# Altium schematic sheet STPMotorControl2_1.SchDoc
size A4; SheetNumber: 3; SheetTotal: 6
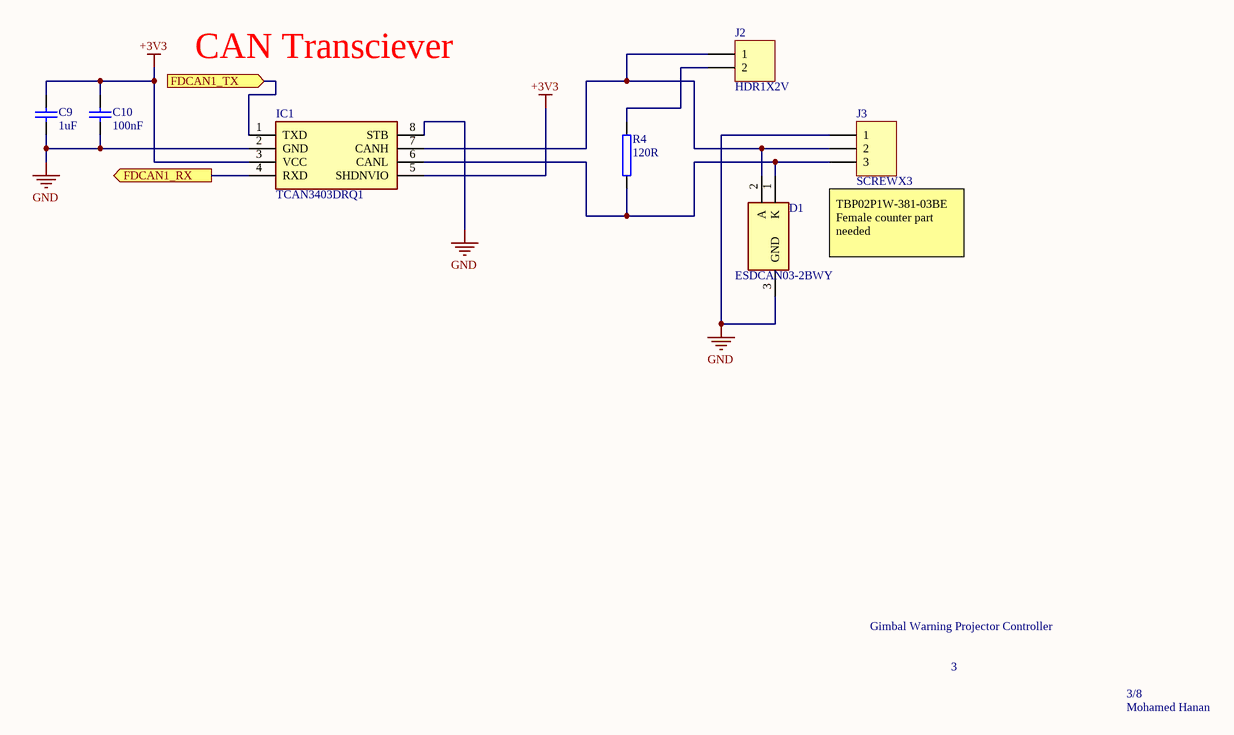
[diagram p0: STPMotorControl2_1.SchDoc]

## Parts
C9  1uF  [CAP_0805]
C10  100nF  [CAP_0805]
D1  ESDCAN03-2BWY  [SOT65P210X110-3N]
IC1  TCAN3403DRQ1  [SOIC127P600X175-8N]
J2  HDR1X2V  [HDR1X2_AUT]
J3  SCREWX3  [SCREW3_AUT]
R4  120R  [RES_1206]

## Ports
FDCAN1_RX (out, see STPMotorConnections[3A], STPMotorControl_1[3C]), FDCAN1_TX (in, see STPMotorConnections[3A], STPMotorControl_1[3C])

## Nets
+3V3: C9.2 C10.2 IC1.3(VCC) IC1.5(SHDNVIO)
GND: C9.1 C10.1 D1.3(GND) IC1.2(GND) IC1.8(STB) J3.1
FDCAN1_RX: IC1.4(RXD) ; port FDCAN1_RX
FDCAN1_TX: IC1.1(TXD) ; port FDCAN1_TX
NetD1_1: D1.1(K) IC1.6(CANL) J3.3 R4.1
NetD1_2: D1.2(A) IC1.7(CANH) J2.1 J3.2
NetJ2_2: J2.2 R4.2

## Notes on the sheet
- CAN Transciever
- (near J3) TBP02P1W-381-03BE
  Female counter part needed
- Gimbal Warning Projector Controller
- 3
- 3/8
- Mohamed Hanan

## Library data of the parts
C9 C10 = CAPN 0805: Non Polarized Capacitor, SMD, 0805
D1 = ESDCAN03-2BWY: TVS Diode (Uni-directional); Manufacturer_Name: STMicroelectronics; Datasheet Link: https://www.st.com/resource/en/datasheet/esdcan03-2bwy.pdf; Height: 1.1mm; Manufacturer_Part_Number: ESDCAN03-2BWY; Mouser Part Number: 511-ESDCAN03-2BWY; Mouser Price/Stock: https://www.mouser.co.uk/ProductDetail/STMicroelectronics/ESDCAN03-2BWY?qs=FqY30PPN9V2iiokjuqa22Q%3D%3D; Arrow Part Number: ESDCAN03-2BWY; Arrow Price/Stock: https://www.arrow.com/en/products/esdcan03-2bwy/stmicroelectronics.html?utm_currency=USD&region=europe
IC1 = TCAN3403DRQ1: Integrated Circuit; Manufacturer_Name: Texas Instruments; Datasheet Link: https://www.ti.com/lit/ds/symlink/tcan3403-q1.pdf?ts=1732780388772&ref_url=https%253A%252F%252Fwww.ti.com%252Fproduct%252FTCAN3403-Q1%252Fpart-details%252FTCAN3403DRQ1; Height: 1.75mm; Manufacturer_Part_Number: TCAN3403DRQ1; Mouser Part Number: 595-TCAN3403DRQ1; Mouser Price/Stock: https://www.mouser.co.uk/ProductDetail/Texas-Instruments/TCAN3403DRQ1?qs=VVKQmw408U8i3BeOClYB9g%3D%3D; Arrow Part Number: TCAN3403DRQ1; Arrow Price/Stock: https://www.arrow.com/en/products/tcan3403drq1/texas-instruments?utm_currency=USD&region=nac
J2 = HDR1X2V: Header, Plug, 2.54mm, 2 Pins, Straight; Supplier 1: Farnell; Supplier Part Number 1: 2254030
J3 = SCREWX3: Terminal Block, PCB, 3Way, Pitch 5mm; Supplier 1: Farnell; Supplier Part Number 1: 9632689
R4 = Resistor 1206: Resistor, SMD, 1206